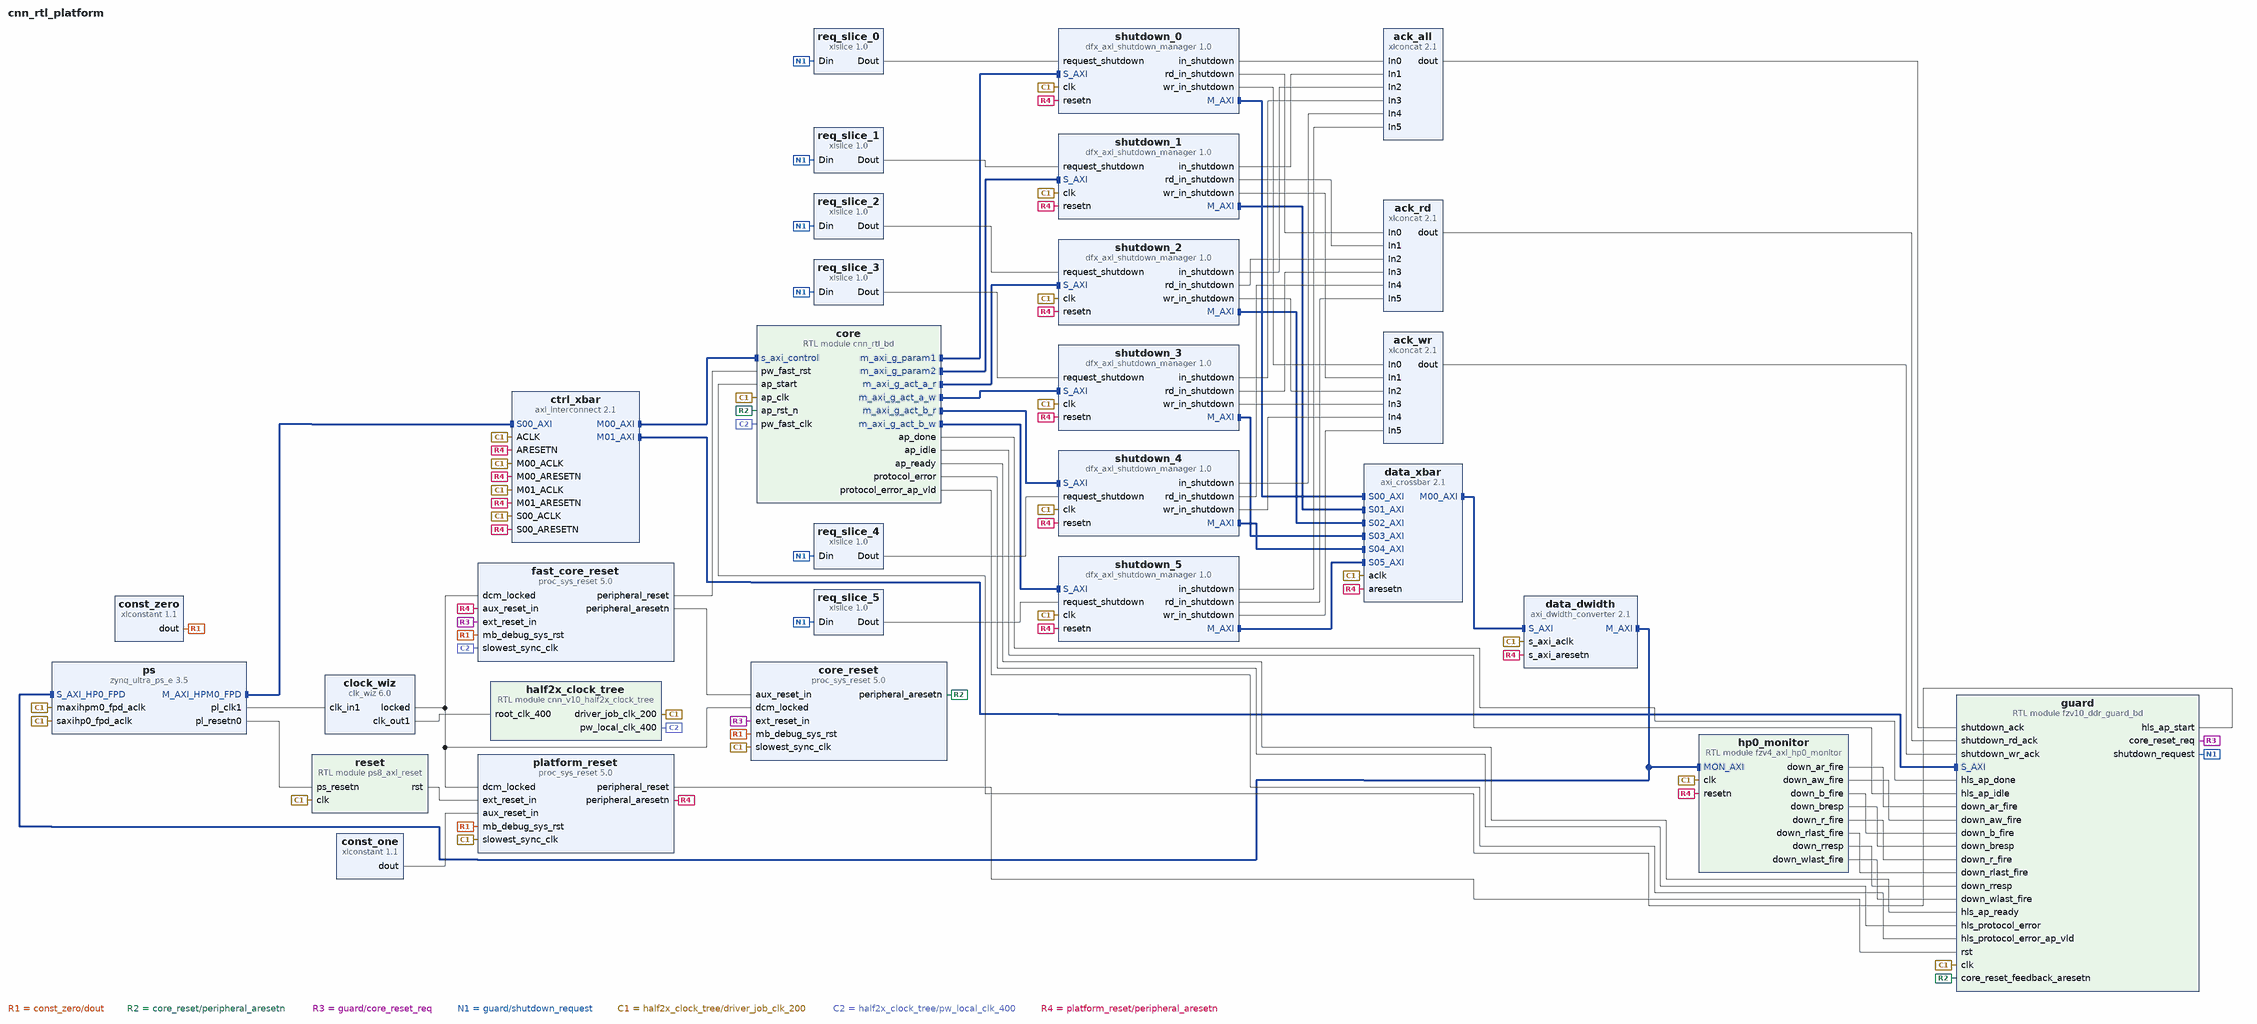
[diagram p0: block diagram of the top level]
# Vivado block design cnn_rtl_platform, xazu3eg-sfvc784-1-i, Vivado 2026.1
create_bd_design cnn_rtl_platform

create_bd_cell -type ip -vlnv xilinx.com:ip:zynq_ultra_ps_e:3.5 ps
set_property -dict [list \
  CONFIG.PSU__DDRC__DEVICE_CAPACITY {4096 MBits} \
  CONFIG.PSU__DDR_HIGH_ADDRESS_GUI_ENABLE 1 \
  CONFIG.PSU__FPGA_PL0_ENABLE 1 \
  CONFIG.PSU__FPGA_PL1_ENABLE 1 \
  CONFIG.PSU__MAXIGP0__DATA_WIDTH 32 \
  CONFIG.PSU__SAXIGP2__DATA_WIDTH 64 \
  CONFIG.PSU__USE__IRQ0 0 \
  CONFIG.PSU__USE__M_AXI_GP0 1 \
  CONFIG.PSU__USE__M_AXI_GP1 0 \
  CONFIG.PSU__USE__M_AXI_GP2 0 \
  CONFIG.PSU__USE__S_AXI_GP2 1 \
] [get_bd_cells ps]
# 41 more settings of ps are not shown: defaults, MIO pin electricals, DDR timing, and values the tool derives
create_bd_cell -type module -reference cnn_rtl_bd core
create_bd_cell -type module -reference fzv10_ddr_guard_bd guard
set_property -dict [list \
  CONFIG.ABI_VERSION_VALUE 0x000A0005 \
  CONFIG.CAPS_VALUE 0x00000FFF \
  CONFIG.ID_VALUE 0x465A5641 \
] [get_bd_cells guard]
create_bd_cell -type module -reference fzv4_axi_hp0_monitor hp0_monitor
create_bd_cell -type module -reference ps8_axi_reset reset
create_bd_cell -type ip -vlnv xilinx.com:ip:clk_wiz:6.0 clock_wiz
set_property -dict [list \
  CONFIG.CLKOUT1_DRIVES No_buffer \
  CONFIG.CLKOUT1_REQUESTED_OUT_FREQ 400.0 \
  CONFIG.NUM_OUT_CLKS 1 \
  CONFIG.PRIM_IN_FREQ 99.999001 \
  CONFIG.PRIM_SOURCE No_buffer \
  CONFIG.USE_LOCKED true \
  CONFIG.USE_RESET false \
] [get_bd_cells clock_wiz]
create_bd_cell -type module -reference cnn_v10_half2x_clock_tree half2x_clock_tree
create_bd_cell -type ip -vlnv xilinx.com:ip:proc_sys_reset:5.0 platform_reset
set_property -dict {CONFIG.C_AUX_RESET_HIGH 0} [get_bd_cells platform_reset]
create_bd_cell -type ip -vlnv xilinx.com:ip:proc_sys_reset:5.0 core_reset
set_property -dict {CONFIG.C_AUX_RESET_HIGH 0} [get_bd_cells core_reset]
create_bd_cell -type ip -vlnv xilinx.com:ip:proc_sys_reset:5.0 fast_core_reset
set_property -dict {CONFIG.C_AUX_RESET_HIGH 0} [get_bd_cells fast_core_reset]
create_bd_cell -type ip -vlnv xilinx.com:ip:axi_interconnect:2.1 ctrl_xbar
set_property -dict {CONFIG.NUM_MI 2 CONFIG.NUM_SI 1 CONFIG.XBAR_DATA_WIDTH 32} [get_bd_cells ctrl_xbar]
create_bd_cell -type ip -vlnv xilinx.com:ip:axi_crossbar:2.1 data_xbar
set_property -dict [list \
  CONFIG.ADDR_RANGES 2 \
  CONFIG.ADDR_WIDTH 64 \
  CONFIG.CONNECTIVITY_MODE SAMD \
  CONFIG.DATA_WIDTH 128 \
  CONFIG.ID_WIDTH 4 \
  CONFIG.M00_A00_ADDR_WIDTH 30 \
  CONFIG.M00_A00_BASE_ADDR 0x0000000040000000 \
  CONFIG.M00_A01_ADDR_WIDTH 30 \
  CONFIG.M00_A01_BASE_ADDR 0x0000000800000000 \
  CONFIG.M00_READ_ISSUING 16 \
  CONFIG.M00_S00_READ_CONNECTIVITY 1 \
  CONFIG.M00_S00_WRITE_CONNECTIVITY 0 \
  CONFIG.M00_S01_READ_CONNECTIVITY 1 \
  CONFIG.M00_S01_WRITE_CONNECTIVITY 0 \
  CONFIG.M00_S02_READ_CONNECTIVITY 1 \
  CONFIG.M00_S02_WRITE_CONNECTIVITY 0 \
  CONFIG.M00_S03_READ_CONNECTIVITY 0 \
  CONFIG.M00_S03_WRITE_CONNECTIVITY 1 \
  CONFIG.M00_S04_READ_CONNECTIVITY 1 \
  CONFIG.M00_S04_WRITE_CONNECTIVITY 0 \
  CONFIG.M00_S05_READ_CONNECTIVITY 0 \
  CONFIG.M00_S05_WRITE_CONNECTIVITY 1 \
  CONFIG.M00_WRITE_ISSUING 16 \
  CONFIG.NUM_MI 1 \
  CONFIG.NUM_SI 6 \
  CONFIG.PROTOCOL AXI4 \
] [get_bd_cells data_xbar]
create_bd_cell -type ip -vlnv xilinx.com:ip:axi_dwidth_converter:2.1 data_dwidth
set_property -dict [list \
  CONFIG.ADDR_WIDTH 64 \
  CONFIG.MI_DATA_WIDTH 64 \
  CONFIG.PACKING_LEVEL 1 \
  CONFIG.PROTOCOL AXI4 \
  CONFIG.READ_WRITE_MODE READ_WRITE \
  CONFIG.SI_DATA_WIDTH 128 \
  CONFIG.SI_ID_WIDTH 4 \
] [get_bd_cells data_dwidth]
create_bd_cell -type ip -vlnv xilinx.com:ip:dfx_axi_shutdown_manager:1.0 shutdown_0
set_property -dict [list \
  CONFIG.CTRL_INTERFACE_TYPE 0 \
  CONFIG.DP_AXI_ADDR_WIDTH 64 \
  CONFIG.DP_AXI_ARUSER_WIDTH 1 \
  CONFIG.DP_AXI_AWUSER_WIDTH 1 \
  CONFIG.DP_AXI_BUSER_WIDTH 1 \
  CONFIG.DP_AXI_DATA_WIDTH 128 \
  CONFIG.DP_AXI_ID_WIDTH 1 \
  CONFIG.DP_AXI_RUSER_WIDTH 1 \
  CONFIG.DP_AXI_WUSER_WIDTH 1 \
  CONFIG.DP_PROTOCOL AXI4MM \
  CONFIG.RESET_ACTIVE_LEVEL 0 \
  CONFIG.RP_IS_MASTER true \
] [get_bd_cells shutdown_0]
create_bd_cell -type ip -vlnv xilinx.com:ip:dfx_axi_shutdown_manager:1.0 shutdown_1
set_property -dict [list \
  CONFIG.CTRL_INTERFACE_TYPE 0 \
  CONFIG.DP_AXI_ADDR_WIDTH 64 \
  CONFIG.DP_AXI_ARUSER_WIDTH 1 \
  CONFIG.DP_AXI_AWUSER_WIDTH 1 \
  CONFIG.DP_AXI_BUSER_WIDTH 1 \
  CONFIG.DP_AXI_DATA_WIDTH 128 \
  CONFIG.DP_AXI_ID_WIDTH 1 \
  CONFIG.DP_AXI_RUSER_WIDTH 1 \
  CONFIG.DP_AXI_WUSER_WIDTH 1 \
  CONFIG.DP_PROTOCOL AXI4MM \
  CONFIG.RESET_ACTIVE_LEVEL 0 \
  CONFIG.RP_IS_MASTER true \
] [get_bd_cells shutdown_1]
create_bd_cell -type ip -vlnv xilinx.com:ip:dfx_axi_shutdown_manager:1.0 shutdown_2
set_property -dict [list \
  CONFIG.CTRL_INTERFACE_TYPE 0 \
  CONFIG.DP_AXI_ADDR_WIDTH 64 \
  CONFIG.DP_AXI_ARUSER_WIDTH 1 \
  CONFIG.DP_AXI_AWUSER_WIDTH 1 \
  CONFIG.DP_AXI_BUSER_WIDTH 1 \
  CONFIG.DP_AXI_DATA_WIDTH 128 \
  CONFIG.DP_AXI_ID_WIDTH 1 \
  CONFIG.DP_AXI_RUSER_WIDTH 1 \
  CONFIG.DP_AXI_WUSER_WIDTH 1 \
  CONFIG.DP_PROTOCOL AXI4MM \
  CONFIG.RESET_ACTIVE_LEVEL 0 \
  CONFIG.RP_IS_MASTER true \
] [get_bd_cells shutdown_2]
create_bd_cell -type ip -vlnv xilinx.com:ip:dfx_axi_shutdown_manager:1.0 shutdown_3
set_property -dict [list \
  CONFIG.CTRL_INTERFACE_TYPE 0 \
  CONFIG.DP_AXI_ADDR_WIDTH 64 \
  CONFIG.DP_AXI_ARUSER_WIDTH 1 \
  CONFIG.DP_AXI_AWUSER_WIDTH 1 \
  CONFIG.DP_AXI_BUSER_WIDTH 1 \
  CONFIG.DP_AXI_DATA_WIDTH 128 \
  CONFIG.DP_AXI_ID_WIDTH 1 \
  CONFIG.DP_AXI_RUSER_WIDTH 1 \
  CONFIG.DP_AXI_WUSER_WIDTH 1 \
  CONFIG.DP_PROTOCOL AXI4MM \
  CONFIG.RESET_ACTIVE_LEVEL 0 \
  CONFIG.RP_IS_MASTER true \
] [get_bd_cells shutdown_3]
create_bd_cell -type ip -vlnv xilinx.com:ip:dfx_axi_shutdown_manager:1.0 shutdown_4
set_property -dict [list \
  CONFIG.CTRL_INTERFACE_TYPE 0 \
  CONFIG.DP_AXI_ADDR_WIDTH 64 \
  CONFIG.DP_AXI_ARUSER_WIDTH 1 \
  CONFIG.DP_AXI_AWUSER_WIDTH 1 \
  CONFIG.DP_AXI_BUSER_WIDTH 1 \
  CONFIG.DP_AXI_DATA_WIDTH 128 \
  CONFIG.DP_AXI_ID_WIDTH 1 \
  CONFIG.DP_AXI_RUSER_WIDTH 1 \
  CONFIG.DP_AXI_WUSER_WIDTH 1 \
  CONFIG.DP_PROTOCOL AXI4MM \
  CONFIG.RESET_ACTIVE_LEVEL 0 \
  CONFIG.RP_IS_MASTER true \
] [get_bd_cells shutdown_4]
create_bd_cell -type ip -vlnv xilinx.com:ip:dfx_axi_shutdown_manager:1.0 shutdown_5
set_property -dict [list \
  CONFIG.CTRL_INTERFACE_TYPE 0 \
  CONFIG.DP_AXI_ADDR_WIDTH 64 \
  CONFIG.DP_AXI_ARUSER_WIDTH 1 \
  CONFIG.DP_AXI_AWUSER_WIDTH 1 \
  CONFIG.DP_AXI_BUSER_WIDTH 1 \
  CONFIG.DP_AXI_DATA_WIDTH 128 \
  CONFIG.DP_AXI_ID_WIDTH 1 \
  CONFIG.DP_AXI_RUSER_WIDTH 1 \
  CONFIG.DP_AXI_WUSER_WIDTH 1 \
  CONFIG.DP_PROTOCOL AXI4MM \
  CONFIG.RESET_ACTIVE_LEVEL 0 \
  CONFIG.RP_IS_MASTER true \
] [get_bd_cells shutdown_5]
create_bd_cell -type ip -vlnv xilinx.com:ip:xlslice:1.0 req_slice_0
set_property -dict {CONFIG.DIN_FROM 0 CONFIG.DIN_TO 0 CONFIG.DIN_WIDTH 6 CONFIG.DOUT_WIDTH 1} [get_bd_cells req_slice_0]
create_bd_cell -type ip -vlnv xilinx.com:ip:xlslice:1.0 req_slice_1
set_property -dict {CONFIG.DIN_FROM 1 CONFIG.DIN_TO 1 CONFIG.DIN_WIDTH 6 CONFIG.DOUT_WIDTH 1} [get_bd_cells req_slice_1]
create_bd_cell -type ip -vlnv xilinx.com:ip:xlslice:1.0 req_slice_2
set_property -dict {CONFIG.DIN_FROM 2 CONFIG.DIN_TO 2 CONFIG.DIN_WIDTH 6 CONFIG.DOUT_WIDTH 1} [get_bd_cells req_slice_2]
create_bd_cell -type ip -vlnv xilinx.com:ip:xlslice:1.0 req_slice_3
set_property -dict {CONFIG.DIN_FROM 3 CONFIG.DIN_TO 3 CONFIG.DIN_WIDTH 6 CONFIG.DOUT_WIDTH 1} [get_bd_cells req_slice_3]
create_bd_cell -type ip -vlnv xilinx.com:ip:xlslice:1.0 req_slice_4
set_property -dict {CONFIG.DIN_FROM 4 CONFIG.DIN_TO 4 CONFIG.DIN_WIDTH 6 CONFIG.DOUT_WIDTH 1} [get_bd_cells req_slice_4]
create_bd_cell -type ip -vlnv xilinx.com:ip:xlslice:1.0 req_slice_5
set_property -dict {CONFIG.DIN_FROM 5 CONFIG.DIN_TO 5 CONFIG.DIN_WIDTH 6 CONFIG.DOUT_WIDTH 1} [get_bd_cells req_slice_5]
create_bd_cell -type ip -vlnv xilinx.com:ip:xlconcat:2.1 ack_all
set_property -dict {CONFIG.NUM_PORTS 6} [get_bd_cells ack_all]
create_bd_cell -type ip -vlnv xilinx.com:ip:xlconcat:2.1 ack_rd
set_property -dict {CONFIG.NUM_PORTS 6} [get_bd_cells ack_rd]
create_bd_cell -type ip -vlnv xilinx.com:ip:xlconcat:2.1 ack_wr
set_property -dict {CONFIG.NUM_PORTS 6} [get_bd_cells ack_wr]
create_bd_cell -type ip -vlnv xilinx.com:ip:xlconstant:1.1 const_zero
set_property -dict {CONFIG.CONST_VAL 0 CONFIG.CONST_WIDTH 1} [get_bd_cells const_zero]
create_bd_cell -type ip -vlnv xilinx.com:ip:xlconstant:1.1 const_one
set_property -dict {CONFIG.CONST_VAL 1 CONFIG.CONST_WIDTH 1} [get_bd_cells const_one]

# ---- connections ----

connect_bd_intf_net [get_bd_intf_pins core/m_axi_g_act_a_r] [get_bd_intf_pins shutdown_2/S_AXI]
connect_bd_intf_net [get_bd_intf_pins core/m_axi_g_act_a_w] [get_bd_intf_pins shutdown_3/S_AXI]
connect_bd_intf_net [get_bd_intf_pins core/m_axi_g_act_b_r] [get_bd_intf_pins shutdown_4/S_AXI]
connect_bd_intf_net [get_bd_intf_pins core/m_axi_g_act_b_w] [get_bd_intf_pins shutdown_5/S_AXI]
connect_bd_intf_net [get_bd_intf_pins core/m_axi_g_param1] [get_bd_intf_pins shutdown_0/S_AXI]
connect_bd_intf_net [get_bd_intf_pins core/m_axi_g_param2] [get_bd_intf_pins shutdown_1/S_AXI]
connect_bd_intf_net [get_bd_intf_pins ctrl_xbar/M00_AXI] [get_bd_intf_pins core/s_axi_control]
connect_bd_intf_net [get_bd_intf_pins ctrl_xbar/M01_AXI] [get_bd_intf_pins guard/S_AXI]
connect_bd_intf_net [get_bd_intf_pins data_dwidth/M_AXI] [get_bd_intf_pins ps/S_AXI_HP0_FPD]
connect_bd_intf_net [get_bd_intf_pins data_dwidth/M_AXI] [get_bd_intf_pins hp0_monitor/MON_AXI]
connect_bd_intf_net [get_bd_intf_pins data_xbar/M00_AXI] [get_bd_intf_pins data_dwidth/S_AXI]
connect_bd_intf_net [get_bd_intf_pins ps/M_AXI_HPM0_FPD] [get_bd_intf_pins ctrl_xbar/S00_AXI]
connect_bd_intf_net [get_bd_intf_pins shutdown_0/M_AXI] [get_bd_intf_pins data_xbar/S00_AXI]
connect_bd_intf_net [get_bd_intf_pins shutdown_1/M_AXI] [get_bd_intf_pins data_xbar/S01_AXI]
connect_bd_intf_net [get_bd_intf_pins shutdown_2/M_AXI] [get_bd_intf_pins data_xbar/S02_AXI]
connect_bd_intf_net [get_bd_intf_pins shutdown_3/M_AXI] [get_bd_intf_pins data_xbar/S03_AXI]
connect_bd_intf_net [get_bd_intf_pins shutdown_4/M_AXI] [get_bd_intf_pins data_xbar/S04_AXI]
connect_bd_intf_net [get_bd_intf_pins shutdown_5/M_AXI] [get_bd_intf_pins data_xbar/S05_AXI]
connect_bd_net [get_bd_pins ack_all/dout] [get_bd_pins guard/shutdown_ack]
connect_bd_net [get_bd_pins ack_rd/dout] [get_bd_pins guard/shutdown_rd_ack]
connect_bd_net [get_bd_pins ack_wr/dout] [get_bd_pins guard/shutdown_wr_ack]
connect_bd_net [get_bd_pins clock_wiz/clk_out1] [get_bd_pins half2x_clock_tree/root_clk_400]
connect_bd_net [get_bd_pins clock_wiz/locked] \
  [get_bd_pins platform_reset/dcm_locked] [get_bd_pins core_reset/dcm_locked] [get_bd_pins fast_core_reset/dcm_locked]
connect_bd_net [get_bd_pins const_one/dout] [get_bd_pins platform_reset/aux_reset_in]
connect_bd_net [get_bd_pins const_zero/dout] \
  [get_bd_pins platform_reset/mb_debug_sys_rst] [get_bd_pins core_reset/mb_debug_sys_rst] \
  [get_bd_pins fast_core_reset/mb_debug_sys_rst]
connect_bd_net [get_bd_pins core/ap_done] [get_bd_pins guard/hls_ap_done]
connect_bd_net [get_bd_pins core/ap_idle] [get_bd_pins guard/hls_ap_idle]
connect_bd_net [get_bd_pins core/ap_ready] [get_bd_pins guard/hls_ap_ready]
connect_bd_net [get_bd_pins core/protocol_error] [get_bd_pins guard/hls_protocol_error]
connect_bd_net [get_bd_pins core/protocol_error_ap_vld] [get_bd_pins guard/hls_protocol_error_ap_vld]
connect_bd_net [get_bd_pins core_reset/peripheral_aresetn] [get_bd_pins core/ap_rst_n] [get_bd_pins guard/core_reset_feedback_aresetn]
connect_bd_net [get_bd_pins fast_core_reset/peripheral_aresetn] [get_bd_pins core_reset/aux_reset_in]
connect_bd_net [get_bd_pins fast_core_reset/peripheral_reset] [get_bd_pins core/pw_fast_rst]
connect_bd_net [get_bd_pins guard/core_reset_req] [get_bd_pins core_reset/ext_reset_in] [get_bd_pins fast_core_reset/ext_reset_in]
connect_bd_net [get_bd_pins guard/hls_ap_start] [get_bd_pins core/ap_start]
connect_bd_net [get_bd_pins guard/shutdown_request] \
  [get_bd_pins req_slice_0/Din] [get_bd_pins req_slice_1/Din] [get_bd_pins req_slice_2/Din] [get_bd_pins req_slice_3/Din] \
  [get_bd_pins req_slice_4/Din] [get_bd_pins req_slice_5/Din]
connect_bd_net [get_bd_pins half2x_clock_tree/driver_job_clk_200] \
  [get_bd_pins ps/maxihpm0_fpd_aclk] [get_bd_pins ps/saxihp0_fpd_aclk] [get_bd_pins ctrl_xbar/ACLK] \
  [get_bd_pins ctrl_xbar/S00_ACLK] [get_bd_pins ctrl_xbar/M00_ACLK] [get_bd_pins ctrl_xbar/M01_ACLK] \
  [get_bd_pins data_xbar/aclk] [get_bd_pins data_dwidth/s_axi_aclk] [get_bd_pins core/ap_clk] [get_bd_pins guard/clk] \
  [get_bd_pins reset/clk] [get_bd_pins hp0_monitor/clk] [get_bd_pins platform_reset/slowest_sync_clk] \
  [get_bd_pins core_reset/slowest_sync_clk] [get_bd_pins shutdown_0/clk] [get_bd_pins shutdown_1/clk] \
  [get_bd_pins shutdown_2/clk] [get_bd_pins shutdown_3/clk] [get_bd_pins shutdown_4/clk] [get_bd_pins shutdown_5/clk]
connect_bd_net [get_bd_pins half2x_clock_tree/pw_local_clk_400] [get_bd_pins core/pw_fast_clk] [get_bd_pins fast_core_reset/slowest_sync_clk]
connect_bd_net [get_bd_pins hp0_monitor/down_ar_fire] [get_bd_pins guard/down_ar_fire]
connect_bd_net [get_bd_pins hp0_monitor/down_aw_fire] [get_bd_pins guard/down_aw_fire]
connect_bd_net [get_bd_pins hp0_monitor/down_b_fire] [get_bd_pins guard/down_b_fire]
connect_bd_net [get_bd_pins hp0_monitor/down_bresp] [get_bd_pins guard/down_bresp]
connect_bd_net [get_bd_pins hp0_monitor/down_r_fire] [get_bd_pins guard/down_r_fire]
connect_bd_net [get_bd_pins hp0_monitor/down_rlast_fire] [get_bd_pins guard/down_rlast_fire]
connect_bd_net [get_bd_pins hp0_monitor/down_rresp] [get_bd_pins guard/down_rresp]
connect_bd_net [get_bd_pins hp0_monitor/down_wlast_fire] [get_bd_pins guard/down_wlast_fire]
connect_bd_net [get_bd_pins platform_reset/peripheral_aresetn] \
  [get_bd_pins ctrl_xbar/ARESETN] [get_bd_pins ctrl_xbar/S00_ARESETN] [get_bd_pins ctrl_xbar/M00_ARESETN] \
  [get_bd_pins ctrl_xbar/M01_ARESETN] [get_bd_pins data_xbar/aresetn] [get_bd_pins data_dwidth/s_axi_aresetn] \
  [get_bd_pins hp0_monitor/resetn] [get_bd_pins shutdown_0/resetn] [get_bd_pins shutdown_1/resetn] \
  [get_bd_pins shutdown_2/resetn] [get_bd_pins shutdown_3/resetn] [get_bd_pins shutdown_4/resetn] \
  [get_bd_pins shutdown_5/resetn] [get_bd_pins fast_core_reset/aux_reset_in]
connect_bd_net [get_bd_pins platform_reset/peripheral_reset] [get_bd_pins guard/rst]
connect_bd_net [get_bd_pins ps/pl_clk1] [get_bd_pins clock_wiz/clk_in1]
connect_bd_net [get_bd_pins ps/pl_resetn0] [get_bd_pins reset/ps_resetn]
connect_bd_net [get_bd_pins req_slice_0/Dout] [get_bd_pins shutdown_0/request_shutdown]
connect_bd_net [get_bd_pins req_slice_1/Dout] [get_bd_pins shutdown_1/request_shutdown]
connect_bd_net [get_bd_pins req_slice_2/Dout] [get_bd_pins shutdown_2/request_shutdown]
connect_bd_net [get_bd_pins req_slice_3/Dout] [get_bd_pins shutdown_3/request_shutdown]
connect_bd_net [get_bd_pins req_slice_4/Dout] [get_bd_pins shutdown_4/request_shutdown]
connect_bd_net [get_bd_pins req_slice_5/Dout] [get_bd_pins shutdown_5/request_shutdown]
connect_bd_net [get_bd_pins reset/rst] [get_bd_pins platform_reset/ext_reset_in]
connect_bd_net [get_bd_pins shutdown_0/in_shutdown] [get_bd_pins ack_all/In0]
connect_bd_net [get_bd_pins shutdown_0/rd_in_shutdown] [get_bd_pins ack_rd/In0]
connect_bd_net [get_bd_pins shutdown_0/wr_in_shutdown] [get_bd_pins ack_wr/In0]
connect_bd_net [get_bd_pins shutdown_1/in_shutdown] [get_bd_pins ack_all/In1]
connect_bd_net [get_bd_pins shutdown_1/rd_in_shutdown] [get_bd_pins ack_rd/In1]
connect_bd_net [get_bd_pins shutdown_1/wr_in_shutdown] [get_bd_pins ack_wr/In1]
connect_bd_net [get_bd_pins shutdown_2/in_shutdown] [get_bd_pins ack_all/In2]
connect_bd_net [get_bd_pins shutdown_2/rd_in_shutdown] [get_bd_pins ack_rd/In2]
connect_bd_net [get_bd_pins shutdown_2/wr_in_shutdown] [get_bd_pins ack_wr/In2]
connect_bd_net [get_bd_pins shutdown_3/in_shutdown] [get_bd_pins ack_all/In3]
connect_bd_net [get_bd_pins shutdown_3/rd_in_shutdown] [get_bd_pins ack_rd/In3]
connect_bd_net [get_bd_pins shutdown_3/wr_in_shutdown] [get_bd_pins ack_wr/In3]
connect_bd_net [get_bd_pins shutdown_4/in_shutdown] [get_bd_pins ack_all/In4]
connect_bd_net [get_bd_pins shutdown_4/rd_in_shutdown] [get_bd_pins ack_rd/In4]
connect_bd_net [get_bd_pins shutdown_4/wr_in_shutdown] [get_bd_pins ack_wr/In4]
connect_bd_net [get_bd_pins shutdown_5/in_shutdown] [get_bd_pins ack_all/In5]
connect_bd_net [get_bd_pins shutdown_5/rd_in_shutdown] [get_bd_pins ack_rd/In5]
connect_bd_net [get_bd_pins shutdown_5/wr_in_shutdown] [get_bd_pins ack_wr/In5]

# ---- address map ----
assign_bd_address -offset 0x0000000040000000 -range 1G -target_address_space [get_bd_addr_spaces core/m_axi_g_act_a_r] [get_bd_addr_segs ps/SAXIGP2/HP0_DDR_LOW]
assign_bd_address -offset 0x0000000800000000 -range 1G -target_address_space [get_bd_addr_spaces core/m_axi_g_act_a_r] [get_bd_addr_segs ps/SAXIGP2/HP0_DDR_HIGH]
assign_bd_address -offset 0x0000000040000000 -range 1G -target_address_space [get_bd_addr_spaces core/m_axi_g_act_a_w] [get_bd_addr_segs ps/SAXIGP2/HP0_DDR_LOW]
assign_bd_address -offset 0x0000000800000000 -range 1G -target_address_space [get_bd_addr_spaces core/m_axi_g_act_a_w] [get_bd_addr_segs ps/SAXIGP2/HP0_DDR_HIGH]
assign_bd_address -offset 0x0000000040000000 -range 1G -target_address_space [get_bd_addr_spaces core/m_axi_g_act_b_r] [get_bd_addr_segs ps/SAXIGP2/HP0_DDR_LOW]
assign_bd_address -offset 0x0000000800000000 -range 1G -target_address_space [get_bd_addr_spaces core/m_axi_g_act_b_r] [get_bd_addr_segs ps/SAXIGP2/HP0_DDR_HIGH]
assign_bd_address -offset 0x0000000040000000 -range 1G -target_address_space [get_bd_addr_spaces core/m_axi_g_act_b_w] [get_bd_addr_segs ps/SAXIGP2/HP0_DDR_LOW]
assign_bd_address -offset 0x0000000800000000 -range 1G -target_address_space [get_bd_addr_spaces core/m_axi_g_act_b_w] [get_bd_addr_segs ps/SAXIGP2/HP0_DDR_HIGH]
assign_bd_address -offset 0x0000000040000000 -range 1G -target_address_space [get_bd_addr_spaces core/m_axi_g_param1] [get_bd_addr_segs ps/SAXIGP2/HP0_DDR_LOW]
assign_bd_address -offset 0x0000000800000000 -range 1G -target_address_space [get_bd_addr_spaces core/m_axi_g_param1] [get_bd_addr_segs ps/SAXIGP2/HP0_DDR_HIGH]
assign_bd_address -offset 0x0000000040000000 -range 1G -target_address_space [get_bd_addr_spaces core/m_axi_g_param2] [get_bd_addr_segs ps/SAXIGP2/HP0_DDR_LOW]
assign_bd_address -offset 0x0000000800000000 -range 1G -target_address_space [get_bd_addr_spaces core/m_axi_g_param2] [get_bd_addr_segs ps/SAXIGP2/HP0_DDR_HIGH]
assign_bd_address -offset 0x00A4000000 -range 64K -target_address_space [get_bd_addr_spaces ps/Data] [get_bd_addr_segs core/s_axi_control/reg0]
assign_bd_address -offset 0x00A4010000 -range 64K -target_address_space [get_bd_addr_spaces ps/Data] [get_bd_addr_segs guard/S_AXI/reg0]

validate_bd_design
save_bd_design
